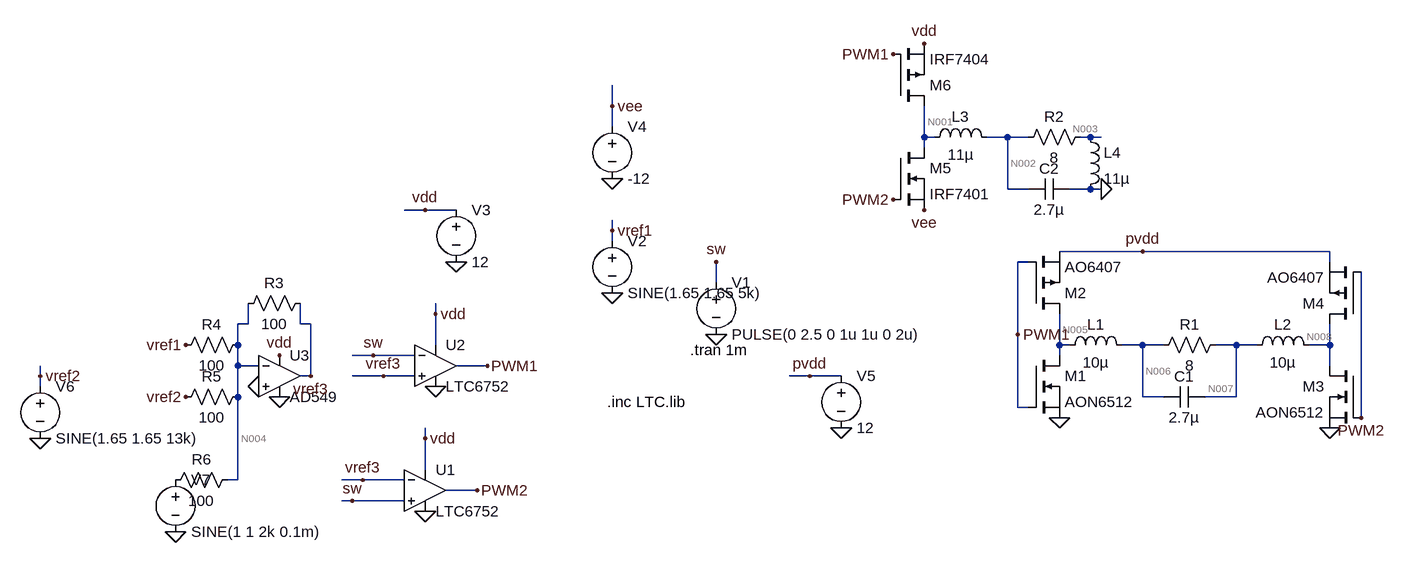
[diagram p0: schematic ClassDAmp.asc]
ClassDAmp.asc, the LTspice schematic file:
Version 4.1
SHEET 1 1164 680
WIRE -80 -176 -80 -208
WIRE -80 -144 -80 -176
WIRE 400 -128 400 -176
WIRE 416 -128 400 -128
WIRE 528 -128 496 -128
WIRE 560 -128 528 -128
WIRE 656 -128 640 -128
WIRE 672 -128 656 -128
WIRE 400 -112 400 -128
WIRE 528 -48 528 -128
WIRE 560 -48 528 -48
WIRE 656 -48 624 -48
WIRE 672 -48 656 -48
WIRE -368 -16 -400 -16
WIRE -320 -16 -368 -16
WIRE -80 16 -80 0
WIRE -80 32 -80 16
WIRE 736 48 608 48
WIRE 1024 48 736 48
WIRE 560 64 544 64
WIRE 1024 64 1024 48
WIRE 80 96 80 64
WIRE -352 144 -352 128
WIRE -640 160 -640 128
WIRE -640 160 -656 160
WIRE -560 160 -560 128
WIRE -544 160 -560 160
WIRE 544 176 544 64
WIRE -656 192 -656 160
WIRE -352 192 -352 144
WIRE 608 192 608 144
WIRE 624 192 608 192
WIRE 736 192 704 192
WIRE 768 192 736 192
WIRE 880 192 848 192
WIRE 912 192 880 192
WIRE 1024 192 1024 160
WIRE 1024 192 992 192
WIRE -448 208 -480 208
WIRE -384 208 -448 208
WIRE 608 208 608 192
WIRE -656 224 -656 192
WIRE -624 224 -656 224
WIRE -272 224 -320 224
WIRE 1024 224 1024 192
WIRE -960 240 -960 224
WIRE -544 240 -544 160
WIRE -544 240 -560 240
WIRE -432 240 -480 240
WIRE -384 240 -432 240
WIRE 224 240 192 240
WIRE 272 240 224 240
WIRE -960 256 -960 240
WIRE -656 272 -656 224
WIRE 736 272 736 192
WIRE 768 272 736 272
WIRE 880 272 880 192
WIRE 880 272 832 272
WIRE 544 288 544 176
WIRE 560 288 544 288
WIRE 1072 304 1072 80
WIRE -368 336 -368 320
WIRE -368 384 -368 336
WIRE -656 400 -656 272
WIRE -656 400 -672 400
WIRE -464 400 -496 400
WIRE -400 400 -464 400
WIRE -288 416 -336 416
WIRE -480 432 -496 432
WIRE -400 432 -480 432
FLAG 80 176 0
FLAG -80 16 vref1
FLAG 80 64 sw
FLAG -352 256 0
FLAG -448 208 sw
FLAG -320 64 0
FLAG -368 -16 vdd
FLAG -352 144 vdd
FLAG 608 304 0
FLAG -80 112 0
FLAG -368 448 0
FLAG -368 336 vdd
FLAG -480 432 sw
FLAG 1024 320 0
FLAG -272 224 PWM1
FLAG -288 416 PWM2
FLAG 352 -32 PWM2
FLAG 352 -256 PWM1
FLAG 672 -48 0
FLAG 400 -272 vdd
FLAG 1072 304 PWM2
FLAG 400 -16 vee
FLAG -80 -64 0
FLAG -80 -176 vee
FLAG 544 176 PWM1
FLAG 272 320 0
FLAG 224 240 pvdd
FLAG 736 48 pvdd
FLAG -592 208 vdd
FLAG -624 256 0
FLAG -736 192 vref1
FLAG -960 240 vref2
FLAG -960 336 0
FLAG -736 272 vref2
FLAG -592 272 0
FLAG -544 240 vref3
FLAG -432 240 vref3
FLAG -464 400 vref3
FLAG -752 480 0
SYMBOL voltage 80 80 R0
WINDOW 123 0 0 Left 0
WINDOW 39 0 0 Left 0
SYMATTR InstName V1
SYMATTR Value PULSE(0 2.5 0 1u 1u 0 2u)
SYMBOL voltage -80 16 R0
WINDOW 123 0 0 Left 0
WINDOW 39 0 0 Left 0
SYMATTR InstName V2
SYMATTR Value SINE(1.65 1.65 5k)
SYMBOL voltage -320 -32 R0
WINDOW 123 0 0 Left 0
WINDOW 39 0 0 Left 0
SYMATTR InstName V3
SYMATTR Value 12
SYMBOL Comparators\\LTC6752 -352 160 R0
SYMATTR InstName U2
SYMBOL nmos 560 208 R0
SYMATTR InstName M1
SYMATTR Value AON6512
SYMBOL Comparators\\LTC6752 -368 352 R0
SYMATTR InstName U1
SYMBOL pmos 560 144 M180
SYMATTR InstName M2
SYMATTR Value AO6407
SYMBOL nmos 1072 224 M0
SYMATTR InstName M3
SYMATTR Value AON6512
SYMBOL pmos 1072 160 R180
SYMATTR InstName M4
SYMATTR Value AO6407
SYMBOL ind 608 208 R270
WINDOW 0 32 56 VTop 2
WINDOW 3 5 56 VBottom 2
SYMATTR InstName L1
SYMATTR Value 10µ
SYMATTR SpiceLine Rser=1m
SYMBOL ind 896 208 R270
WINDOW 0 32 56 VTop 2
WINDOW 3 5 56 VBottom 2
SYMATTR InstName L2
SYMATTR Value 10µ
SYMATTR SpiceLine Rser=1m
SYMBOL res 864 176 R90
WINDOW 0 0 56 VBottom 2
WINDOW 3 32 56 VTop 2
SYMATTR InstName R1
SYMATTR Value 8
SYMBOL cap 832 256 R90
WINDOW 0 0 32 VBottom 2
WINDOW 3 32 32 VTop 2
SYMATTR InstName C1
SYMATTR Value 2.7µ
SYMBOL nmos 352 -112 R0
SYMATTR InstName M5
SYMATTR Value IRF7401
SYMBOL pmos 352 -176 M180
SYMATTR InstName M6
SYMATTR Value IRF7404
SYMBOL ind 400 -112 R270
WINDOW 0 32 56 VTop 2
WINDOW 3 5 56 VBottom 2
SYMATTR InstName L3
SYMATTR Value 11µ
SYMATTR SpiceLine Rser=1m
SYMBOL res 656 -144 R90
WINDOW 0 0 56 VBottom 2
WINDOW 3 32 56 VTop 2
SYMATTR InstName R2
SYMATTR Value 8
SYMBOL cap 624 -64 R90
WINDOW 0 0 32 VBottom 2
WINDOW 3 32 32 VTop 2
SYMATTR InstName C2
SYMATTR Value 2.7µ
SYMBOL voltage -80 -160 R0
WINDOW 123 0 0 Left 0
WINDOW 39 0 0 Left 0
SYMATTR InstName V4
SYMATTR Value -12
SYMBOL voltage 272 224 R0
WINDOW 123 0 0 Left 0
WINDOW 39 0 0 Left 0
SYMATTR InstName V5
SYMATTR Value 12
SYMBOL res -544 112 R90
WINDOW 0 0 56 VBottom 2
WINDOW 3 32 56 VTop 2
SYMATTR InstName R3
SYMATTR Value 100
SYMBOL res -640 176 R90
WINDOW 0 0 56 VBottom 2
WINDOW 3 32 56 VTop 2
SYMATTR InstName R4
SYMATTR Value 100
SYMBOL res -640 256 R90
WINDOW 0 0 56 VBottom 2
WINDOW 3 32 56 VTop 2
SYMATTR InstName R5
SYMATTR Value 100
SYMBOL voltage -960 240 R0
WINDOW 123 0 0 Left 0
WINDOW 39 0 0 Left 0
SYMATTR InstName V6
SYMATTR Value SINE(1.65 1.65 13k)
SYMBOL OpAmps\\AD549 -592 176 R0
SYMATTR InstName U3
SYMBOL ind 640 -144 R0
SYMATTR InstName L4
SYMATTR Value 11µ
SYMATTR SpiceLine Rser=1m
SYMBOL res -656 384 R90
WINDOW 0 0 56 VBottom 2
WINDOW 3 32 56 VTop 2
SYMATTR InstName R6
SYMATTR Value 100
SYMBOL voltage -752 384 R0
WINDOW 123 0 0 Left 0
WINDOW 39 0 0 Left 0
SYMATTR InstName V7
SYMATTR Value SINE(1 1 2k 0.1m)
TEXT 40 200 Left 2 !.tran 1m
TEXT -88 280 Left 2 !.inc LTC.lib

The netlist it stands for:
* ClassDAmp.asc
V1 sw 0 PULSE(0 2.5 0 1u 1u 0 2u)
V2 vref1 0 SINE(1.65 1.65 5k)
V3 vdd 0 12
X§U2 vref3 sw vdd 0 PWM1 LTC6752  ; pins In+ In- V+ V- OUT
M1 N005 PWM1 0 0 AON6512
X§U1 sw vref3 vdd 0 PWM2 LTC6752  ; pins In+ In- V+ V- OUT
M2 N005 PWM1 pvdd pvdd AO6407
M3 N008 PWM2 0 0 AON6512
M4 N008 PWM2 pvdd pvdd AO6407
L1 N005 N006 10µ Rser=1m
L2 N007 N008 10µ Rser=1m
R1 N007 N006 8
C1 N007 N006 2.7µ
M5 N001 PWM2 vee vee IRF7401
M6 N001 PWM1 vdd vdd IRF7404
L3 N001 N002 11µ Rser=1m
R2 N003 N002 8
C2 0 N002 2.7µ
V4 vee 0 -12
V5 pvdd 0 12
R3 vref3 N004 100
R4 N004 vref1 100
R5 N004 vref2 100
V6 vref2 0 SINE(1.65 1.65 13k)
X§U3 0 N004 vdd 0 vref3 AD549  ; pins In+ In- V+ V- OUT
L4 N003 0 11µ Rser=1m
R6 N004 P001 100
V7 P001 0 SINE(1 1 2k 0.1m)
.model NMOS NMOS
.model PMOS PMOS
.lib standard.mos
.tran 1m
.inc LTC.lib
.lib LTC7.lib
.backanno
.end

* Results of the author's LTspice run, read from the files saved beside the schematic
* Operating Point, zero values left out:
*   V(n001) = -11.97 V
*   V(n002) = -11.97 V
*   V(n003) = -1.496 mV
*   V(n004) = 1.391 V
*   V(n005) = 1.542 mV
*   V(n006) = 3.036 mV
*   V(n007) = 11.96 V
*   V(n008) = 11.96 V
*   V(p001) = 1 V
*   V(pvdd) = 12 V
*   V(pwm1) = 12 V
*   V(pwm2) = 126 nV
*   V(vdd) = 12 V
*   V(vee) = -12 V
*   V(vref1) = 1.65 V
*   V(vref2) = 1.65 V
*   V(vref3) = 1.264 V
*   I(L1) = -1.494 A
*   I(L2) = -1.494 A
*   I(L3) = -1.496 A
*   I(L4) = -1.496 A
*   I(R1) = 1.494 A
*   I(R2) = 1.496 A
*   I(R3) = -1.271 mA
*   I(R4) = -2.59 mA
*   I(R5) = -2.59 mA
*   I(R6) = 3.91 mA
*   I(V1) = 6.426 µA
*   I(V2) = -2.59 mA
*   I(V3) = -16.26 mA
*   I(V4) = 1.496 A
*   I(V5) = -1.494 A
*   I(V6) = -2.59 mA
*   I(V7) = 3.91 mA
*   Id(M1) = 1.494 A
*   Id(M2) = -18.04 nA
*   Id(M3) = 11.61 pA
*   Id(M4) = -1.494 A
*   Id(M5) = 1.496 A
*   Id(M6) = -413.2 pA
*   Is(M1) = -1.494 A
*   Is(M2) = 18.04 nA
*   Is(M3) = -11.61 pA
*   Is(M4) = 1.494 A
*   Is(M5) = -1.496 A
*   Is(M6) = 413.2 pA
*   Ix(u1:1) = -3.213 µA
*   Ix(u1:2) = -1.483 µA
*   Ix(u1:3) = 8.071 mA
*   Ix(u1:4) = -8.067 mA
*   Ix(u1:5) = 12 pA
*   Ix(u2:1) = -1.483 µA
*   Ix(u2:2) = -3.213 µA
*   Ix(u2:3) = 8.072 mA
*   Ix(u2:4) = -8.067 mA
*   Ix(u2:5) = -12 pA
*   Ix(u3:3) = 118.9 µA
*   Ix(u3:4) = -1.393 mA
*   Ix(u3:5) = 1.274 mA